# Altium schematic sheet STPMotorControl5_1.SchDoc
size A4; SheetNumber: 6; SheetTotal: 8
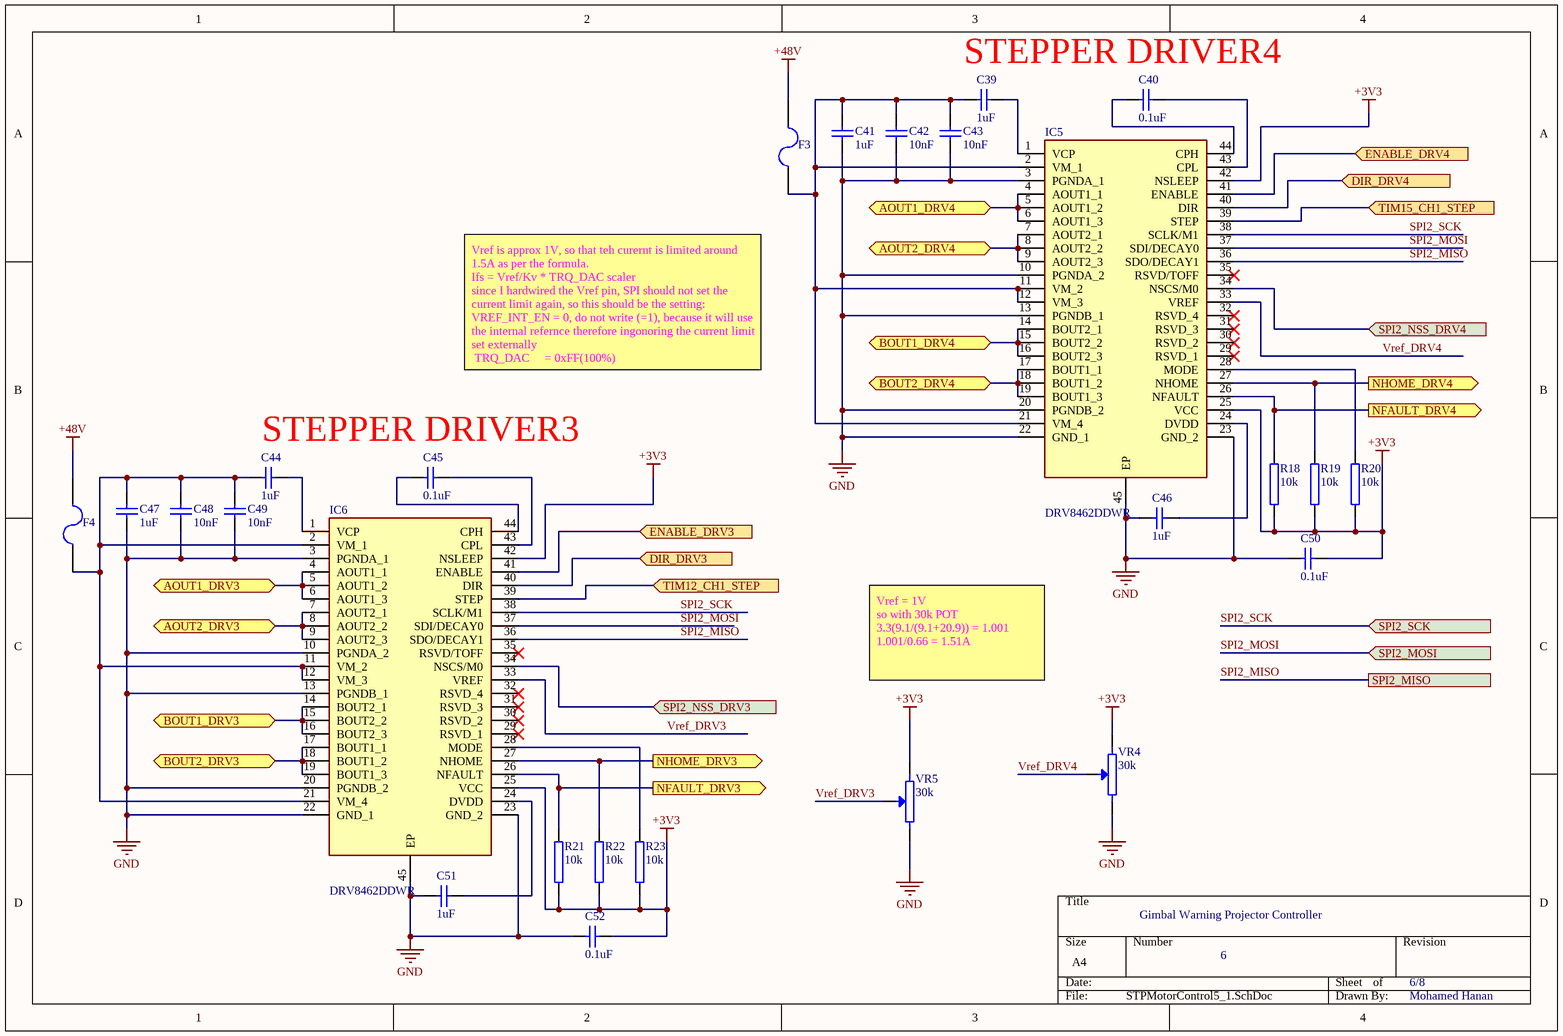
[diagram p0: STPMotorControl5_1.SchDoc]

## Parts
C39  1uF  [CAP_0805]
C40  0.1uF  [CAP_1206]
C41  1uF  [CAP_0805]
C42  10nF  [CAP_0805]
C43  10nF  [CAP_0805]
C44  1uF  [CAP_0805]
C45  0.1uF  [CAP_1206]
C46  1uF  [CAP_0805]
C47  1uF  [CAP_0805]
C48  10nF  [CAP_0805]
C49  10nF  [CAP_0805]
C50  0.1uF  [CAP_1206]
C51  1uF  [CAP_0805]
C52  0.1uF  [CAP_1206]
F3  1206L035/16YR  [MC36207]  (value not drawn)
F4  1206L035/16YR  [MC36207]  (value not drawn)
IC5  DRV8462DDWR  [SOP64P810X120-45N]
IC6  DRV8462DDWR  [SOP64P810X120-45N]
R18  10k  [RES_0805]
R19  10k  [RES_0805]
R20  10k  [RES_0805]
R21  10k  [RES_0805]
R22  10k  [RES_0805]
R23  10k  [RES_0805]
VR4  30k  [3362S]
VR5  30k  [3362S]

## Ports
AOUT1_DRV3 (bidir, see STPMotorConnections[2B], STPMotorControl7_1[1B]), AOUT1_DRV4 (bidir, see STPMotorConnections[2B], STPMotorControl7_1[1C]), AOUT2_DRV3 (bidir, see STPMotorConnections[2B], STPMotorControl7_1[1B]), AOUT2_DRV4 (bidir, see STPMotorConnections[2B], STPMotorControl7_1[1C]), BOUT1_DRV3 (bidir, see STPMotorConnections[2B], STPMotorControl7_1[1B]), BOUT1_DRV4 (bidir, see STPMotorConnections[2C], STPMotorControl7_1[1C]), BOUT2_DRV3 (bidir, see STPMotorConnections[2B], STPMotorControl7_1[1B]), BOUT2_DRV4 (bidir, see STPMotorConnections[2C], STPMotorControl7_1[1C]), DIR_DRV3 (in, see STPMotorConnections[1B], STPMotorControl_1[3D]), DIR_DRV4 (in, see STPMotorConnections[1C], STPMotorControl_1[3D]), ENABLE_DRV3 (in, see STPMotorConnections[1C]), ENABLE_DRV4 (in, see STPMotorConnections[1C]), NFAULT_DRV3 (out, see STPMotorConnections[2C], STPMotorControl_1[1B]), NFAULT_DRV4 (out, see STPMotorConnections[2C], STPMotorControl_1[1B]), NHOME_DRV3 (out, see STPMotorConnections[2C], STPMotorControl_1[2D]), NHOME_DRV4 (out, see STPMotorConnections[2C], STPMotorControl_1[2D]), SPI2_MISO (see STPMotorConnections[1C], STPMotorControl4_1[4C], STPMotorControl6_1[4C], STPMotorControl_1[3C]), SPI2_MOSI (in, see STPMotorConnections[1C], STPMotorControl4_1[4C], STPMotorControl6_1[4C], STPMotorControl_1[3B]), SPI2_NSS_DRV3 (in, see STPMotorConnections[2C], STPMotorControl_1[3A]), SPI2_NSS_DRV4 (in, see STPMotorConnections[2C], STPMotorControl_1[3A]), SPI2_SCK (in, see STPMotorConnections[1C], STPMotorControl4_1[4C], STPMotorControl6_1[4C], STPMotorControl_1[3B]), TIM12_CH1_STEP (in, see STPMotorConnections[1B], STPMotorControl_1[3C]), TIM15_CH1_STEP (in, see STPMotorConnections[1B], STPMotorControl_1[3A])

## Nets
+3V3: C50.1 C52.1 IC5.25(VCC) IC5.42(NSLEEP) IC6.25(VCC) IC6.42(NSLEEP) R18.1 R19.1 R20.1 R21.1 R22.1 R23.1 VR4.1(TOP) VR5.1(TOP)
+48V: F3.2 F4.2
GND: C41.1 C42.1 C43.1 C46.2 C47.1 C48.1 C49.1 C50.2 C51.2 C52.2 IC5.3(PGNDA_1) IC5.10(PGNDA_2) IC5.13(PGNDB_1) IC5.20(PGNDB_2) IC5.22(GND_1) IC5.23(GND_2) IC5.45(EP) IC6.3(PGNDA_1) IC6.10(PGNDA_2) IC6.13(PGNDB_1) IC6.20(PGNDB_2) IC6.22(GND_1) IC6.23(GND_2) IC6.45(EP) VR4.2(BOT) VR5.2(BOT)
AOUT1_DRV3: IC6.4(AOUT1_1) IC6.5(AOUT1_2) IC6.6(AOUT1_3) ; port AOUT1_DRV3
AOUT1_DRV4: IC5.4(AOUT1_1) IC5.5(AOUT1_2) IC5.6(AOUT1_3) ; port AOUT1_DRV4
AOUT2_DRV3: IC6.7(AOUT2_1) IC6.8(AOUT2_2) IC6.9(AOUT2_3) ; port AOUT2_DRV3
AOUT2_DRV4: IC5.7(AOUT2_1) IC5.8(AOUT2_2) IC5.9(AOUT2_3) ; port AOUT2_DRV4
BOUT1_DRV3: IC6.14(BOUT2_1) IC6.15(BOUT2_2) IC6.16(BOUT2_3) ; port BOUT1_DRV3
BOUT1_DRV4: IC5.14(BOUT2_1) IC5.15(BOUT2_2) IC5.16(BOUT2_3) ; port BOUT1_DRV4
BOUT2_DRV3: IC6.17(BOUT1_1) IC6.18(BOUT1_2) IC6.19(BOUT1_3) ; port BOUT2_DRV3
BOUT2_DRV4: IC5.17(BOUT1_1) IC5.18(BOUT1_2) IC5.19(BOUT1_3) ; port BOUT2_DRV4
DIR_DRV3: IC6.40(DIR) ; port DIR_DRV3
DIR_DRV4: IC5.40(DIR) ; port DIR_DRV4
ENABLE_DRV3: IC6.41(ENABLE) ; port ENABLE_DRV3
ENABLE_DRV4: IC5.41(ENABLE) ; port ENABLE_DRV4
NFAULT_DRV3: IC6.26(NFAULT) R21.2 ; port NFAULT_DRV3
NFAULT_DRV4: IC5.26(NFAULT) R18.2 ; port NFAULT_DRV4
NHOME_DRV3: IC6.27(NHOME) R22.2 ; port NHOME_DRV3
NHOME_DRV4: IC5.27(NHOME) R19.2 ; port NHOME_DRV4
SPI2_MISO: IC5.36(SDO/DECAY1) IC6.36(SDO/DECAY1) ; port SPI2_MISO
SPI2_MOSI: IC5.37(SDI/DECAY0) IC6.37(SDI/DECAY0) ; port SPI2_MOSI
SPI2_NSS_DRV3: IC6.34(NSCS/M0) ; port SPI2_NSS_DRV3
SPI2_NSS_DRV4: IC5.34(NSCS/M0) ; port SPI2_NSS_DRV4
SPI2_SCK: IC5.38(SCLK/M1) IC6.38(SCLK/M1) ; port SPI2_SCK
TIM12_CH1_STEP: IC6.39(STEP) ; port TIM12_CH1_STEP
TIM15_CH1_STEP: IC5.39(STEP) ; port TIM15_CH1_STEP
Vref_DRV3: IC6.33(VREF) VR5.W(TAP)
Vref_DRV4: IC5.33(VREF) VR4.W(TAP)
NetC39_1: C39.1 IC5.1(VCP)
NetC39_2: C39.2 C41.2 C42.2 C43.2 F3.1 IC5.2(VM_1) IC5.11(VM_2) IC5.12(VM_3) IC5.21(VM_4)
NetC40_1: C40.1 IC5.43(CPL)
NetC40_2: C40.2 IC5.44(CPH)
NetC44_1: C44.1 IC6.1(VCP)
NetC44_2: C44.2 C47.2 C48.2 C49.2 F4.1 IC6.2(VM_1) IC6.11(VM_2) IC6.12(VM_3) IC6.21(VM_4)
NetC45_1: C45.1 IC6.43(CPL)
NetC45_2: C45.2 IC6.44(CPH)
NetC46_1: C46.1 IC5.24(DVDD)
NetC51_1: C51.1 IC6.24(DVDD)
NetIC5_28: IC5.28(MODE) R20.2
NetIC6_28: IC6.28(MODE) R23.2

Not connected (* = marked no-connect by the designer): IC5 29(RSVD_1)* 30(RSVD_2)* 31(RSVD_3)* 32(RSVD_4)* 35(RSVD/TOFF)*; IC6 29(RSVD_1)* 30(RSVD_2)* 31(RSVD_3)* 32(RSVD_4)* 35(RSVD/TOFF)*

## Notes on the sheet
- STEPPER DRIVER4
- Vref is approx 1V, so that teh curernt is limited around 1.5A as per the formula.
  Ifs = Vref/Kv * TRQ_DAC scaler
  since I hardwired the Vref pin, SPI should not set the current limit again, so this should be the setting:
  VREF_INT_EN = 0, do not write (=1), because it will use the internal refernce therefore ingonoring the current limit set externally
  TRQ_DAC     = 0xFF(100%)
- STEPPER DRIVER3
- Vref = 1V
  so with 30k POT
  3.3(9.1/(9.1+20.9)) = 1.001
  1.001/0.66 = 1.51A
- Gimbal Warning Projector Controller
- 6
- 6/8
- Mohamed Hanan

## Library data of the parts
C39 C41-C44 C46-C49 C51 = CAPN 0805: Non Polarized Capacitor, SMD, 0805
C40 C45 C50 C52 = CAPN 1206: Non Polarized Capacitor, SMD, 1206
F3 F4 = 1206L035/16YR: Fuse, PTC Reset, 350mA Hold, 750mA Tripping, 16v; Supplier 1: Element14; Supplier Part Number 1: 1822203
IC5 IC6 = DRV8462DDWR: Integrated Circuit; Manufacturer_Name: Texas Instruments; Datasheet Link: https://www.ti.com/lit/gpn/drv8462; Height: 1.2mm; Manufacturer_Part_Number: DRV8462DDWR; Mouser Part Number: 595-DRV8462DDWR; Mouser Price/Stock: https://www.mouser.co.uk/ProductDetail/Texas-Instruments/DRV8462DDWR?qs=rQFj71Wb1eVexvYNsDfnvA%3D%3D; Arrow Part Number: DRV8462DDWR; Arrow Price/Stock: https://www.arrow.com/en/products/drv8462ddwr/texas-instruments?utm_currency=USD&region=nac
R18-R23 = Resistor 0805: Resistor, SMD, 0805
VR4 VR5 = 3362S-1-202LF: 3362S Series, 1/4 ” Square  Potentiometer, 2k, 10%, 0.5 Watts, 1Turn; Supplier 1: Farnell; Supplier Part Number 1: 2321842